# Altium project EMGfrontend.PrjPcb
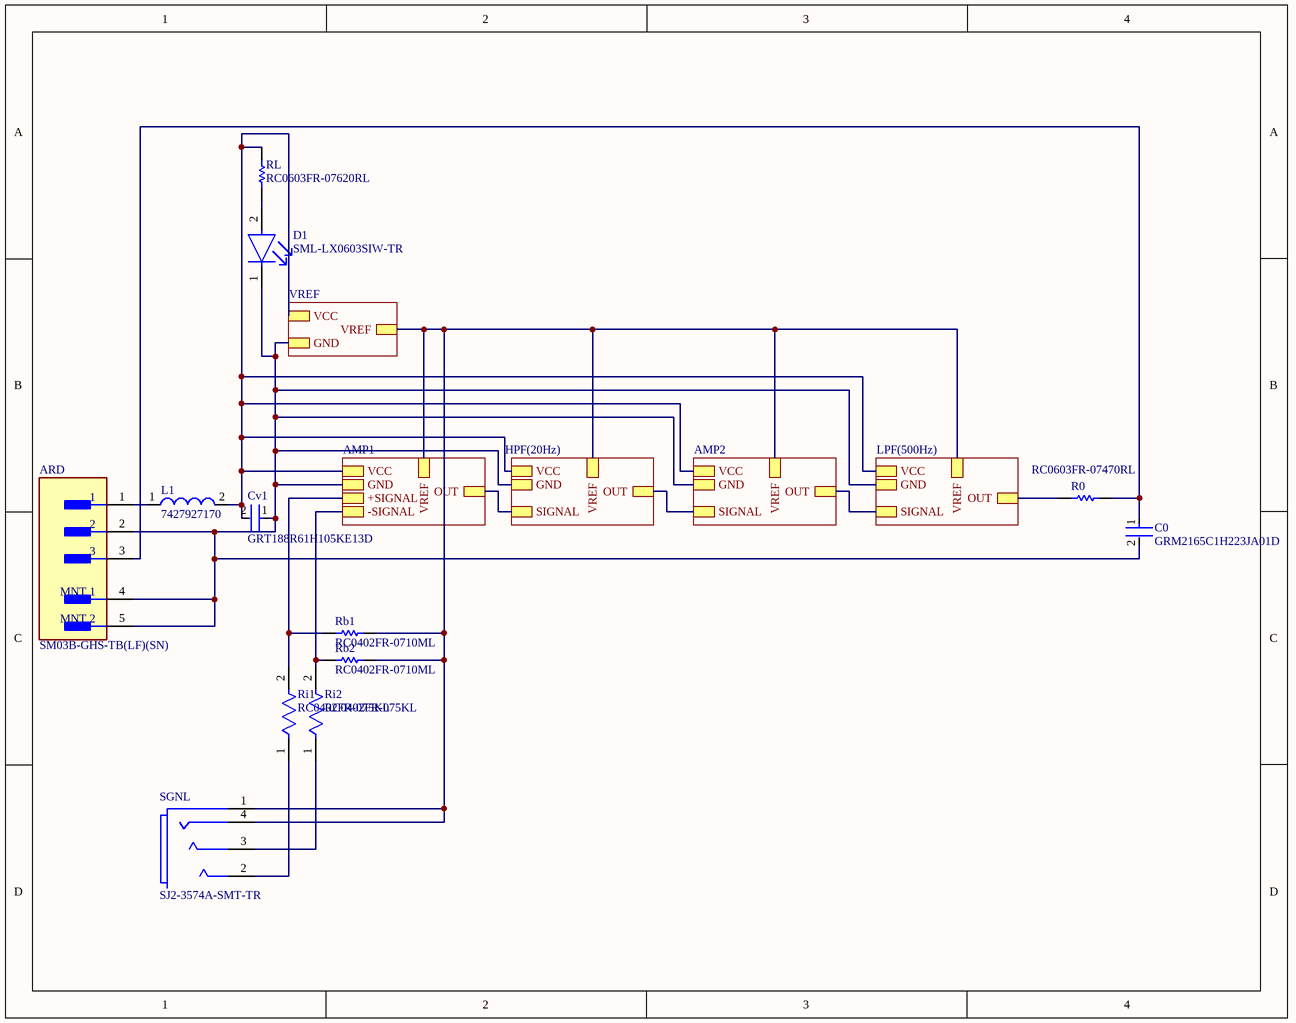
[diagram p0: EMGfrontend.SchDoc]
6 sheets, 35 parts. Net scope: hierarchical (ports join the sheet entries above them; power ports are global).
Board file: EMGfrontend.PcbDoc
Sheets:
  EMGfrontend.SchDoc
    VREF = VREF.SchDoc
    AMP2 = AMP2.SchDoc
    LPF(500Hz) = LPF(500Hz).SchDoc
    AMP1 = AMP1.SchDoc
    HPF(20Hz) = HPF(20Hz).SchDoc

## Sheet EMGfrontend.SchDoc
size A; SheetNumber: 1; SheetTotal: 6

### Parts
ARD  SM03B-GHS-TB(LF)(SN)  [FP-SM03B-GHS-TB_LF_SN-MFG]
C0  GRM2165C1H223JA01D  [FP-GRM216-0_1-0_05-D]
Cv1  GRT188R61H105KE13D  [FP-GRT188-0_1-e0_2_0_5-IPC_B]
D1  SML-LX0603SIW-TR  [FP-SML-LX0603SIW-TR-MFG]
L1  7427927170  [SMD-0402]
R0  RC0603FR-07470RL  [RESC1608X55X25LL10T15]
Rb1  RC0402FR-0710ML  [RESC1005X40X25MML05T10]
Rb2  RC0402FR-0710ML  [RESC1005X40X25MML05T10]
Ri1  RC0402FR-075KL  [FP-RC0402-MFG-TINY]
Ri2  RC0402FR-075KL  [FP-RC0402-MFG-TINY]
RL  RC0603FR-07620RL  [RESC1608X55X25ML10T15]
SGNL  SJ2-3574A-SMT-TR  [FP-SJ2-3574A-SMT-TR-MFG]

### Sub-sheets
AMP1 = AMP1.SchDoc: VREF, +SIGNAL, OUT, GND, VCC, -SIGNAL
AMP2 = AMP2.SchDoc: VREF, SIGNAL, VCC, GND, OUT
HPF(20Hz) = HPF(20Hz).SchDoc: SIGNAL, VREF, OUT, VCC, GND
LPF(500Hz) = LPF(500Hz).SchDoc: SIGNAL, VCC, GND, VREF, OUT
VREF = VREF.SchDoc: VREF, VCC, GND

### Nets
NetARD_1: ARD.1 L1.1
NetARD_2: ARD.2 ARD.4(MNT_1) ARD.5(MNT_2) C0.2 Cv1.1 D1.1(C) ; sheet VREF/GND, sheet AMP2/GND, sheet LPF(500Hz)/GND, sheet AMP1/GND, sheet HPF(20Hz)/GND
NetARD_3: ARD.3 C0.1 R0.2
NetC1_1: Rb1.2 Rb2.2 SGNL.1(sleeve) SGNL.4(ring_2) ; sheet VREF/VREF, sheet AMP2/VREF, sheet LPF(500Hz)/VREF, sheet AMP1/VREF, sheet HPF(20Hz)/VREF
NetC3_1: sheet AMP1/OUT, sheet HPF(20Hz)/SIGNAL
NetC4_2: R0.1 ; sheet LPF(500Hz)/OUT
NetCd1_1: Cv1.2 L1.2 RL.2 ; sheet VREF/VCC, sheet AMP2/VCC, sheet LPF(500Hz)/VCC, sheet AMP1/VCC, sheet HPF(20Hz)/VCC
NetD1_2: D1.2(A) RL.1
NetR5_2: sheet AMP2/SIGNAL, sheet HPF(20Hz)/OUT
NetR9_1: sheet AMP2/OUT, sheet LPF(500Hz)/SIGNAL
NetRb1_1: Rb1.1 Ri1.2 ; sheet AMP1/+SIGNAL
NetRb2_1: Rb2.1 Ri2.2 ; sheet AMP1/-SIGNAL
NetRi1_1: Ri1.1 SGNL.2(tip)
NetRi2_1: Ri2.1 SGNL.3(ring_1)

### Library data of the parts
ARD = CMP-17439-000068-1: CONN HEADER SMD R/A 3POS 1.25MM; Voltage Rating: 50V; Wire/Cable Gauge: 26AWG; Pitch: 0.049inch; Gender: Male; Number of Positions: 3; Current Rating: 1A; Orientation: Right Angle; REACH SVHC: No SVHC; Insulation Color: Natural; Housing Material: Nylon; Mount: Surface Mount; Flammability Rating: UL94 V-0; Color: Natural; Number of Rows: 1; Housing Color: Natural; Termination: Solder; Voltage Rating (AC): 50V; Max Operating Temperature: 85°C; Connector Type: Header; Series: GH; Packaging: Tape and Reel; Contact Finish - Mating: TIN; Lead Free: Lead Free; Fastening Type: Ramp; Contact Plating: Tin; Contact Material: Bronze; Insulation Material: Nylon; Contact Type: Outer Shroud Contact; Number of Contacts: 3; Min Operating Temperature: -25°C; Contact Shape: Rectangular
C0 = CMP-06035-050815-1: Chip Multilayer Ceramic Capacitors for General Purpose, 0805, 22000pF, C0G, 30ppm/°C, 5%, 50V
Cv1 = CMP-06035-031856-1: Multi-Layer Ceramic Capacitor 1uF 50V X5R ±10% 0603 Paper T/R; Voltage Rating (DC): 50V; Voltage Rating: 50V; Min Operating Temperature: -55°C; Case Code (Metric): 1608; Thickness: 0.035inch; Width: 0.031inch; Capacitance: 1uF; Tolerance: 10%; Max Operating Temperature: 85°C; Dielectric: X5R; Case Code (Imperial): 0603; Case/Package: 0603; Length: 0.063inch; Packaging: Tape and Reel; Mount: Surface Mount; Ratings: AEC-Q200
D1 = CMP-57192-000009-1: LED RED DIFFUSED SMD; Test Current: 20mA; Forward Voltage: 2V; Approvals: UL; Dominant Wavelength: 636nm; Viewing Angle: 140°; Lens Color: White; Luminous Intensity: 60mcd; Power Rating: 50mW; Number of LEDs: 1; Color: Red; Forward Current: 20mA; Moisture Sensitivity Level: 2; Case Code (Imperial): 0603; Lead Free: Lead Free; Lens Transparency: Diffused; Case Code (Metric): 1608; Height: 0.6mm; Max Operating Temperature: 85°C; Width: 0.8mm; Lens Style: Diffused; Illumination Color: Red; Wavelength: 636nm; REACH SVHC: No SVHC; Package Quantity: 1; RoHS Compliant: Yes; Case/Package: 0603; Number of Pins: 2; Packaging: Tape and Reel; Length: 1.6mm; Mount: Surface Mount; Min Operating Temperature: -25°C
L1 = CMP-0220-00142-1: SMD EMI Suppression Ferrite Bead WE-CBF, Z = 75 Ohm; Impedance: 75 Ohm; ComponentLink2Description: Datasheet; ComponentLink2URL: http://www.we-online.de/katalog/media/pdf/7427927170.pdf; ComponentLink1URL: http://www.we-online.com; PackageVersion: 2009; ComponentLink1Description: Manufacturer Link; PackageReference: SMD-0402; PackageDescription: Chip Inductor, 2-Leads, Body 1.0 x 0.5 mm; DatasheetVersion: ver 1, Jul-2009
R0 = CMP-1659-00035-2: General Purpose Chip Resistor, 470 Ohm, +/- 1%, -55 to 155 degC, 0603 (1608 Metric), RoHS, Tape and Reel; Resistance: 470 Ohm; ComponentLink1Description: Manufacturer URL; Contact Plating: Gold; Width: 3.1 mm; Radiation Hardening: No; DatasheetVersion: Rev. 4, 04/2009; Length: 3 mm; PackageDescription: 2-Pin Surface Mount Device, Body 1.6 x 0.8 mm; ComponentLink1URL: http://www.yageo.com/; Min Operating Temperature: -40 degC; Mount: Surface Mount; Package Quantity: 2500; ComponentLink2URL: https://datasheet.ciiva.com/11808/0900766b80f96399-11808177.pdf; RoHSCompliant: true; Fastening Type: Snap; PackageReference: 0603; Max Operating Temperature: 90 degC; Height: 1.25 mm; Packaging: Tape and Reel; ComponentLink2Description: Datasheet; Contact Material: Brass
Rb1 Rb2 = CMP-2002-07354-1: Manufacturer: Yageo / Phycomp; Part Number: RC0402FR-0710ML
Ri1 Ri2 = CMP-03412-013078-1: RES SMD 5K OHM 1% 1/16W 0402; Manufacturer: Yageo; Resistance: 5kΩ; Temperature Coefficient: 100ppm/°C; Power Rating: 0.0625W; Voltage Rating: 50V; Value: 5kΩ; Temperature Range Low: -55°C; Lead Free: Yes; RoHS: TRUE; Device Class L2: Resistors; Package: RC0402; Footprint Url: https://pccomponents.com/datasheets/YAGEO-20RESISTORS.PDF; Height: 0.4mm; ComponentLink2URL: http://www.yageo.com/documents/recent/PYu-RC_Group_51_RoHS_L_10.pdf; Temperature: -55°C to +155°C; Composition: Thick Film; Device Class L1: Passive Components; Series: RC_L; Ipc Land Pattern Name: RESC10050X35; Tolerance: 1%; Device Class L3: Chip SMD Resistors; Temperature Range High: +155°C; Category: Res; Automotive: No; Octopart: https://octopart.com/rc0402fr-075kl-yageo-25450038; Digikey Description: RES SMD 5K OHM 1% 1/16W 0402; ComponentLink2Description: Datasheet; Manufacturer Part Number: RC0402FR-075KL
RL = CMP-2000-04103-1: Manufacturer: Yageo; Part Number: RC0603FR-07620RL
SGNL = CMP-14818-000001-1: AUDIO JACK, 3.5 MM, RT, 4 CONDUC; Manufacturer: CUI; Conn Orientation: Horizontal; Current Rating: 1A; Number Of Contacts: 4; Voltage Rating: 12V; Package: SJ2-3574A-SMT-TR; Device Class L1: Connectors; Lead Free: Yes; Digikey Description: AUDIO JACK, 3.5 MM, RT, 4 CONDUC; Device Class L2: Audio / Video Connectors; ComponentLink2URL: https://www.cui.com/product/resource/sj2-357x-smt.pdf; Automotive: No; RoHS: TRUE; Height: 5.3mm; Temperature Range Low: -25°C; Category: Conn; Temperature: -25°C to +85°C; Octopart: https://octopart.com/sj2-3574a-smt-tr-cui-77838840; Device Class L3: unset; Contact Material: Silver; Manufacturer Part Number: SJ2-3574A-SMT-TR; Temperature Range High: +85°C; ComponentLink2Description: Datasheet

## Sheet VREF.SchDoc
size A; SheetNumber: 2; SheetTotal: 6
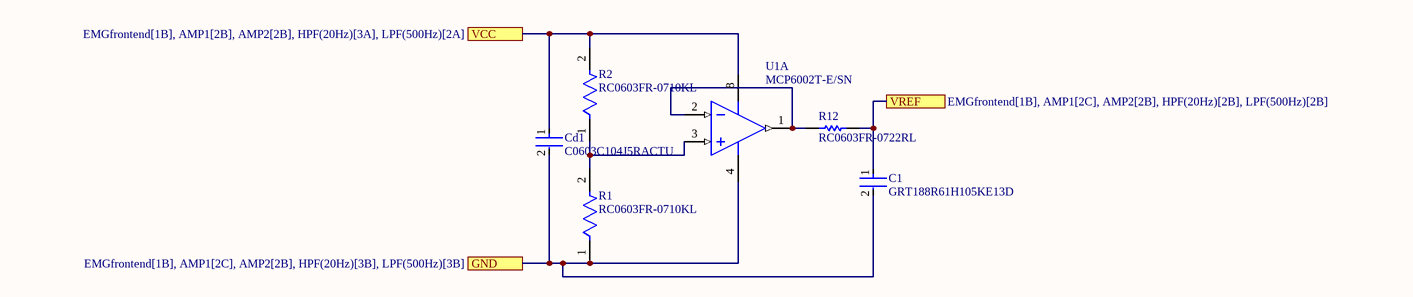
[diagram p1: VREF.SchDoc]

### Parts
C1  GRT188R61H105KE13D  [FP-GRT188-0_1-e0_2_0_5-IPC_B]
Cd1  C0603C104J5RACTU  [FP-C0603C-CF-MFG]
R1  RC0603FR-0710KL  [FP-RC0603-0_55-IPC_C]
R2  RC0603FR-0710KL  [FP-RC0603-0_55-IPC_C]
R12  RC0603FR-0722RL  [RESC1608X55X25NL10T15]
U1  MCP6002T-E/SN  [SOIC-SN8_N]  (part A of 2)

### Ports
GND (see EMGfrontend[1B], AMP1[2C], AMP2[2B], HPF(20Hz)[3B], LPF(500Hz)[3B]), VCC (see EMGfrontend[1B], AMP1[2B], AMP2[2B], HPF(20Hz)[3A], LPF(500Hz)[2A]), VREF (see EMGfrontend[1B], AMP1[2C], AMP2[2B], HPF(20Hz)[2B], LPF(500Hz)[2B])

### Nets
NetARD_2: C1.2 Cd1.2 R1.1 U1.4(VSS) ; port GND
NetC1_1: C1.1 R12.2 ; port VREF
NetCd1_1: Cd1.1 R2.2 U1.8(VDD) ; port VCC
NetR1_2: R1.2 R2.1 U1.3(VINA+)
NetR12_1: R12.1 U1.1(VOUTA) U1.2(VINA-)

### Notes on the sheet
- (in symbol CMP-06302-000184-2) +; -

### Library data of the parts
C1 = CMP-06035-031856-1: as Cv1 on sheet EMGfrontend; Voltage Rating (DC): 50V; Voltage Rating: 50V; Min Operating Temperature: -55°C; Case Code (Metric): 1608; Thickness: 0.035inch; Width: 0.031inch; Capacitance: 1uF; Tolerance: 10%; Max Operating Temperature: 85°C; Dielectric: X5R; Case Code (Imperial): 0603; Case/Package: 0603; Length: 0.063inch; Packaging: Tape and Reel; Mount: Surface Mount; Ratings: AEC-Q200
Cd1 = CMP-2006-03056-2: CAP CER 0.1UF 50V 5% X7R 0603; Manufacturer: KEMET; Automotive Grade: Grade 1; Tolerance: 0.05; Capacitance: 0.10 μF; Value: 0.10 μF; Temperature Coefficient: 30ppm/°C; ComponentLink2Description: Datasheet; Voltage Rating: 50 V; Digikey Description: CAP CER 0.1UF 50V 5% X7R 0603; Manufacturer Part Number: C0603C104J5RACTU; Temperature Range High: +125°C; Device Class L2: Capacitors; Octopart: https://octopart.com/c0603c104j5ractu-kemet-10440638; RoHS: TRUE; Mouser Description: Multilayer Ceramic Capacitors MLCC - SMD/SMT 50volts 0.1uF X7R 5%; Temperature Range Low: -55°C; Automotive: Yes; Lead Free: Yes; ComponentLink2URL: https://api.kemet.com/component-edge/download/datasheet/C0603C100J5GACAUTO.pdf; Material: Ceramic; Device Class L3: Ceramic Capacitors; Package: C0603C-CF; Category: Cap; Temperature: -55°C to +125°C; Height: 0.87mm; Temperature Characteristic: X7R; Device Class L1: Passive Components
R1 R2 = CMP-2100-03664-2: RES 10K OHM 1% 1/10W 0603; Voltage Rating: 75V; Voltage Rating (DC): 50V; Resistance: 10kR; Power Rating: 100mW; Temperature Coefficient: 100ppm/°C; Depth: 0.8mm; Termination: SMD/SMT; Resistor Type: Thick Film; Series: RC; Construction: Rectangular; Features: Moisture Resistant; Packaging: Tape and Reel; Min Operating Temperature: -55°C; Number of Terminations: 2; Lead Pitch: 0.3mm; RoHS Compliant: Yes; Case/Package: 0603; Resistance Tolerance: 1%; Military Standard: Not; Weight: 7.1E-05oz; Number of Pins: 2; Tolerance: 1%; Length: 1.6mm; Case Code (Imperial): 0603; Lead Free: Lead Free; Width: 0.8mm; Max Power Dissipation: 100mW; Height: 0.45mm; Max Operating Temperature: 155°C; Case Code (Metric): 1608; Size Code: 0603
R12 = CMP-1659-00033-1: Chip Resistor, 22 Ohm, +/- 1%, 0.1 W, -55 to 155 degC, 0603 (1608 Metric), RoHS, Tape and Reel; Max Ouput Current: 8 A; Case\Package: SIP; Max Input Voltage: 1.4 V; ComponentLink2URL: http://www.yageo.com/documents/recent/PYu-RC_Group_51_RoHS_L_04.pdf; RoHSCompliant: true; Max Operating Temperature: 100 degC; PackageDescription: 2-Pin Surface Mount Device, Body 1.6 x 0.8 mm; ComponentLink1Description: Manufacturer URL; ComponentLink1URL: http://www.yageo.com/; Length: 18.5 mm; REACH SVHC: Unknown; Pins: 4; DatasheetVersion: Rev. 4, 02/2016; PackageReference: 0603; Output Current: 8 A; Min Operating Temperature: -25 degC; Height: 19.6 mm; Mount: Through Hole; Radiation Hardening: No; ComponentLink2Description: Datasheet; Package Quantity: 200; Packaging: Rail/Tube
U1 = CMP-0187-00363-3: None; Nominal Supply Current: 100uA; Operating Supply Voltage: 5.5V; Input Bias Current: 1pA; Output Current per Channel: 23mA; Unity Gain Bandwidth Product: 1MHz; Number of Elements: 2; Power Supply Rejection Ratio (PSRR): 86dB; Slew Rate: 0.6V/µs; Min Supply Voltage: 1.8V; Voltage Gain: 112dB; Max Supply Voltage: 6V; Input Offset Voltage (Vos): 4.5mV; Common Mode Rejection Ratio: 60dB; Amplifier Type: GENERAL PURPOSE; Technology: CMOS; Output Current: 23mA; Number of Pins: 8; Lead Free: Lead Free; Number of Channels: 2; Package Quantity: 3300; Max Operating Temperature: 125°C; Number of Circuits: 2; Supply Current: 100uA; Gain Bandwidth Product: 1MHz; Min Operating Temperature: -40°C; Series: -; Mount: Surface Mount; Case/Package: SOIC; Radiation Hardening: No; Packaging: Tape and Reel; Operating Supply Current: 100uA; RoHS Compliant: Yes

## Sheet AMP2.SchDoc
size A; SheetNumber: 5; SheetTotal: 6
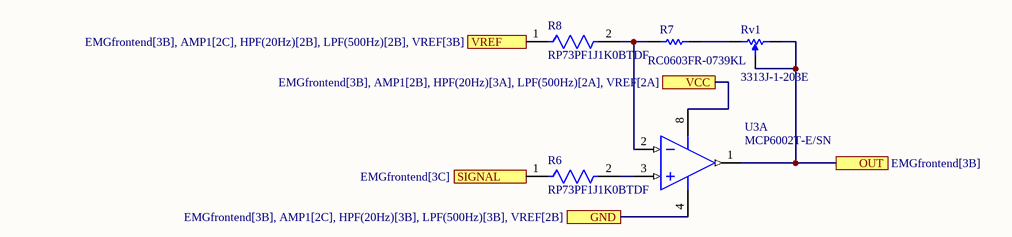
[diagram p2: AMP2.SchDoc]

### Parts
R6  RP73PF1J1K0BTDF  [FP-RP73P-1J-MFG]
R7  RC0603FR-0739KL  [RESC1608X55X25LL10T15]
R8  RP73PF1J1K0BTDF  [FP-RP73P-1J-MFG]
Rv1  3313J-1-203E  [BOUR-3313J-1_V]
U3  MCP6002T-E/SN  [SOIC-SN8_N]  (part A of 2)

### Ports
GND (see EMGfrontend[3B], AMP1[2C], HPF(20Hz)[3B], LPF(500Hz)[3B], VREF[2B]), OUT (see EMGfrontend[3B]), SIGNAL (see EMGfrontend[3C]), VCC (see EMGfrontend[3B], AMP1[2B], HPF(20Hz)[3A], LPF(500Hz)[2A], VREF[2A]), VREF (see EMGfrontend[3B], AMP1[2C], HPF(20Hz)[2B], LPF(500Hz)[2B], VREF[3B])

### Nets
NetARD_2: U3.4(VSS) ; port GND
NetC1_1: R8.1 ; port VREF
NetCd1_1: U3.8(VDD) ; port VCC
NetR5_2: R6.1 ; port SIGNAL
NetR6_2: R6.2 U3.3(VINA+)
NetR7_1: R7.1 R8.2 U3.2(VINA-)
NetR7_2: R7.2 Rv1.1
NetR9_1: Rv1.2 Rv1.3 U3.1(VOUTA) ; port OUT

### Library data of the parts
R6 R8 = CMP-03211-004517-1: RES SMD 1K OHM 0.1% 1/6W 0603; Manufacturer: TE Connectivity; Value: 1KΩ; Power Rating: 0.166W; Tolerance: 0.001; Temperature Coefficient: 25ppm/°C; Voltage Rating: 100V; Composition: Thin Film; Category: Res; Temperature Range High: +155°C; Device Class L1: Passive Components; Digikey Description: RES SMD 1K OHM 0.1% 1/6W 0603; Lead Free: Yes; RoHS: TRUE; Ipc Land Pattern Name: RESC15580X45; Automotive: No; Temperature: -55°C to +155°C; Height: 0.55mm; ComponentLink2URL: https://www.te.com/commerce/DocumentDelivery/DDEController?Action=srchrtrv&DocNm=1773272&DocType=DS&DocLang=English; Manufacturer Part Number: RP73PF1J1K0BTDF; Resistance: 1KΩ; ComponentLink2Description: Datasheet; Temperature Range Low: -55°C; Octopart: https://octopart.com/rp73pf1j1k0btdf-te+connectivity-45465729; Device Class L3: Chip SMD Resistors; Series: RP73P; Package: RP73P-1J; Device Class L2: Resistors
R7 = CMP-2000-06940-1: Chip Resistor, 39 KOhm, +/- 1%, 0.1 W, -55 to 155 degC, 0603 (1608 Metric), RoHS, Tape and Reel; Manufacturer: Yageo; Resistance: 39kOhms; Voltage Rating: 50V; Power Rating: 100mW; Temperature Coefficient: 100PPM/C; Product: ThickFilmResistorsGeneralPurpose; Case Code - in: 0603; Tolerance: 1%; Operating Temperature Range: -55Cto+155C; Series: RC; Package Description: 2-Pin Surface Mount Device, Body 1.6 x 0.8 mm; Datasheet URL: http://www.yageo.com/documents/recent/PYu-RC_Group_51_RoHS_L_7.pdf; Package Reference: 0603; Case Code - mm: 1608; Datasheet Version: Rev. 7, 05/2017; Mounting Technology: SurfaceMount; Packaging: Reel; Manufacturer URL: http://www.yageo.com/; Termination Style: SMD/SMT
Rv1 = CMP-2000-05586-1: 3 mm Trimpot(R) Trimming Potentiometer, 20 KOhm, +/- 20%, 0.125 W, -55 to 125 degC, 3-Pin SMD, RoHS, Tape and Reel; Manufacturer: Bourns; Insulation Resistance: 100Megohms(Min.)@500VDC; Rotational Life: 100Cycles; Resolution: Infinite; Brand/Series: Trimpot®3313-SealedSeries; Temperature, Operating, Maximum: +125°C; Resistance: 20Kilohms; Resistance, Insulation: 100Megohms; Material, Element: Cermet; Standards: RoHSCompliant; Dielectric Strength: 500VAC; Load Life: 1000hr@0.125W,70°C; Torque: 50g-cm; Temperature Coefficient: ±100ppm/°C; Number of Turns: 1; Power, Rating: 0.125W; Angle, Mechanical: 250°; Temperature, Operating, Minimum: -55°C; Package Reference: 3313J-1; Dimensions: 0.126"Lx0.138"Wx0.087"H; Tolerance: ±20%; Type: Trimmer; Package Description: 3-Pin Surface Mount Device, Body 3.5 x 3.2 mm, Pitch 1.15 mm; Mounting Technology: SurfaceMount; Datasheet URL: http://www.bourns.com/docs/Product-Datasheets/3313.pdf; Mounting Type: SurfaceMount; Manufacturer URL: http://www.bourns.com/; Datasheet Version: 05/2016; Termination: SMD
U3 = CMP-0187-00363-3: as U1 on sheet VREF; Technology: CMOS; Output Current: 23mA; Number of Pins: 8; Lead Free: Lead Free; Number of Channels: 2; Package Quantity: 3300; Max Operating Temperature: 125°C; Number of Circuits: 2; Supply Current: 100uA; Gain Bandwidth Product: 1MHz; Min Operating Temperature: -40°C; Series: -; Mount: Surface Mount; Case/Package: SOIC; Radiation Hardening: No; Packaging: Tape and Reel; Operating Supply Current: 100uA; RoHS Compliant: Yes

## Sheet LPF(500Hz).SchDoc
size A; SheetNumber: 6; SheetTotal: 6
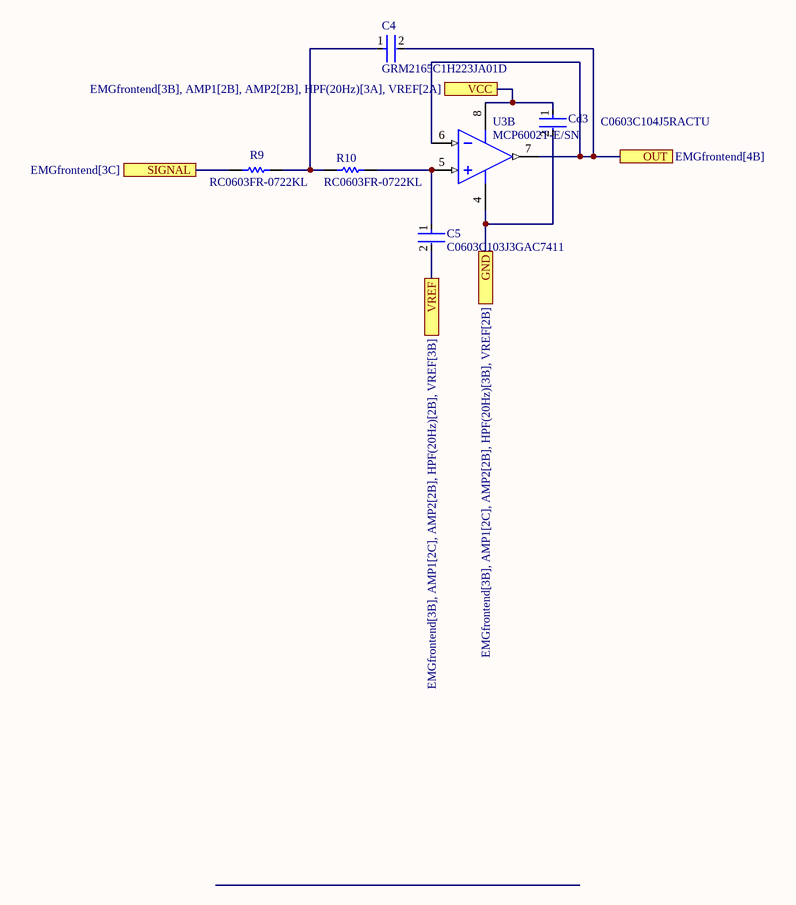
[diagram p3: LPF(500Hz).SchDoc]

### Parts
C4  GRM2165C1H223JA01D  [FP-GRM216-0_1-0_05-D]
C5  C0603C103J3GAC7411  [FP-C0603C-CF-MFG]
Cd3  C0603C104J5RACTU  [FP-C0603C-CF-MFG]
R9  RC0603FR-0722KL  [RESC1608X55X25ML10T15]
R10  RC0603FR-0722KL  [RESC1608X55X25ML10T15]
U3  MCP6002T-E/SN  [SOIC-SN8_N]  (part B of 2)

### Ports
GND (see EMGfrontend[3B], AMP1[2C], AMP2[2B], HPF(20Hz)[3B], VREF[2B]), OUT (see EMGfrontend[4B]), SIGNAL (see EMGfrontend[3C]), VCC (see EMGfrontend[3B], AMP1[2B], AMP2[2B], HPF(20Hz)[3A], VREF[2A]), VREF (see EMGfrontend[3B], AMP1[2C], AMP2[2B], HPF(20Hz)[2B], VREF[3B])

### Nets
NetARD_2: Cd3.2 U3.4(VSS) ; port GND
NetC1_1: C5.2 ; port VREF
NetC4_1: C4.1 R9.2 R10.1
NetC4_2: C4.2 U3.6(VINB-) U3.7(VOUTB) ; port OUT
NetC5_1: C5.1 R10.2 U3.5(VINB+)
NetCd1_1: Cd3.1 U3.8(VDD) ; port VCC
NetR9_1: R9.1 ; port SIGNAL

### Library data of the parts
C4 = CMP-06035-050815-1: as C0 on sheet EMGfrontend
C5 = CMP-03020-031050-2: C0603 10,000 pF C0G 30ppm/°C 5.00% 25 V; Manufacturer: KEMET; Tolerance: 0.05; Material: Ceramic; Automotive Grade: Grade 1; Voltage Rating: 25 V; Device Class L3: Ceramic Capacitors; ComponentLink2URL: https://api.kemet.com/component-edge/download/datasheet/C0603C100J5GACAUTO.pdf; Capacitance: 10,000 pF; RoHS: TRUE; Manufacturer Part Number: C0603C103J3GAC7411; Temperature Coefficient: 30ppm/°C; Lead Free: Yes; Height: 0.87mm; Temperature Range Low: -55°C; Value: 10,000 pF; Temperature Range High: +125°C; ComponentLink2Description: Datasheet; Package: C0603C-CF; Temperature Characteristic: C0G; Temperature: -55°C to +125°C; Category: Cap; Octopart: https://octopart.com/c0603c103j3gac7411-kemet-91893810; Device Class L2: Capacitors; Device Class L1: Passive Components; Automotive: Yes
Cd3 = CMP-2006-03056-2: as Cd1 on sheet VREF; ComponentLink2Description: Datasheet; Voltage Rating: 50 V; Digikey Description: CAP CER 0.1UF 50V 5% X7R 0603; Manufacturer Part Number: C0603C104J5RACTU; Temperature Range High: +125°C; Device Class L2: Capacitors; Octopart: https://octopart.com/c0603c104j5ractu-kemet-10440638; RoHS: TRUE; Mouser Description: Multilayer Ceramic Capacitors MLCC - SMD/SMT 50volts 0.1uF X7R 5%; Temperature Range Low: -55°C; Automotive: Yes; Lead Free: Yes; ComponentLink2URL: https://api.kemet.com/component-edge/download/datasheet/C0603C100J5GACAUTO.pdf; Material: Ceramic; Device Class L3: Ceramic Capacitors; Package: C0603C-CF; Category: Cap; Temperature: -55°C to +125°C; Height: 0.87mm; Temperature Characteristic: X7R; Device Class L1: Passive Components
R9 R10 = CMP-1012-00659-3: Chip Resistor, 22 KOhm, +/- 1%, 0.1 W, -55 to 155 degC, 0603 (1608 Metric), RoHS, Tape and Reel; Tolerance: 10%; Current Rating: 290 mA; Shielding: Unshielded; Resistance: 2.9 Ohm; PackageReference: 0603; PackageDescription: 2-Pin Surface Mount Device, Body 1.6 x 0.8 mm; ComponentLink2URL: http://www.yageo.com/documents/recent/PYu-RC_Group_51_RoHS_L_04.pdf; RoHSCompliant: True; REACH SVHC: No SVHC; ComponentLink1Description: Manufacturer URL; ComponentLink2Description: Datasheet; DatasheetVersion: Rev. 4, 02/2016; Min Operating Temperature: -55degC; Pins: 2; Mount: Through Hole; Height: 11 mm; Packaging: Bulk; Radiation Hardening: No; Package Quantity: 100; Diameter: 8.5 mm; Lead Pitch: 5 mm; Case/Package: Radial; Max Operating Temperature: 105degC; ComponentLink1URL: http://www.yageo.com/
U3 = CMP-0187-00363-3: as U1 on sheet VREF; Technology: CMOS; Output Current: 23mA; Number of Pins: 8; Lead Free: Lead Free; Number of Channels: 2; Package Quantity: 3300; Max Operating Temperature: 125°C; Number of Circuits: 2; Supply Current: 100uA; Gain Bandwidth Product: 1MHz; Min Operating Temperature: -40°C; Series: -; Mount: Surface Mount; Case/Package: SOIC; Radiation Hardening: No; Packaging: Tape and Reel; Operating Supply Current: 100uA; RoHS Compliant: Yes

## Sheet AMP1.SchDoc
size A; SheetNumber: 3; SheetTotal: 6
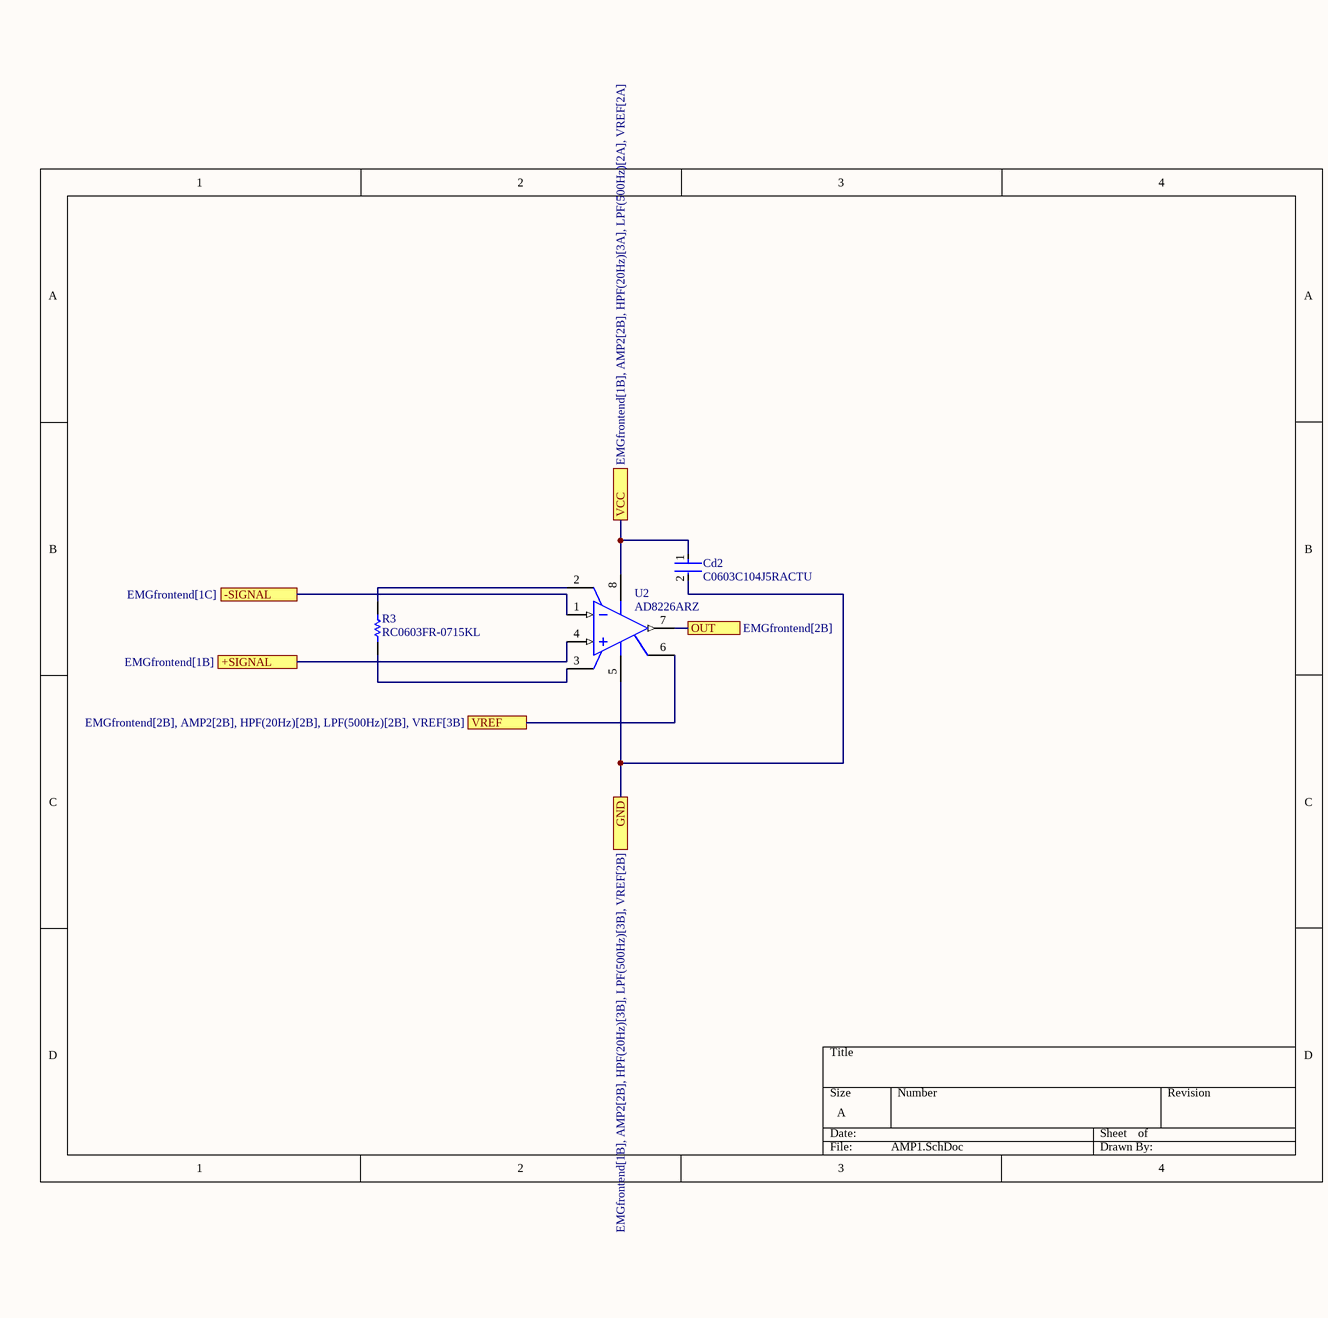
[diagram p4: AMP1.SchDoc]

### Parts
Cd2  C0603C104J5RACTU  [FP-C0603C-CF-MFG]
R3  RC0603FR-0715KL  [RESC1608X55X25LL10T15]
U2  AD8226ARZ  [ADI-R-8_L]

### Ports
+SIGNAL (see EMGfrontend[1B]), -SIGNAL (see EMGfrontend[1C]), GND (see EMGfrontend[1B], AMP2[2B], HPF(20Hz)[3B], LPF(500Hz)[3B], VREF[2B]), OUT (see EMGfrontend[2B]), VCC (see EMGfrontend[1B], AMP2[2B], HPF(20Hz)[3A], LPF(500Hz)[2A], VREF[2A]), VREF (see EMGfrontend[2B], AMP2[2B], HPF(20Hz)[2B], LPF(500Hz)[2B], VREF[3B])

### Nets
NetARD_2: Cd2.2 U2.5(-VS) ; port GND
NetC1_1: U2.6(REF) ; port VREF
NetC3_1: U2.7(VOUT) ; port OUT
NetCd1_1: Cd2.1 U2.8(+VS) ; port VCC
NetR3_1: R3.1 U2.3(RG)
NetR3_2: R3.2 U2.2(RG)
NetRb1_1: U2.4(+IN) ; port +SIGNAL
NetRb2_1: U2.1(-IN) ; port -SIGNAL

### Library data of the parts
Cd2 = CMP-2006-03056-2: as Cd1 on sheet VREF; ComponentLink2Description: Datasheet; Voltage Rating: 50 V; Digikey Description: CAP CER 0.1UF 50V 5% X7R 0603; Manufacturer Part Number: C0603C104J5RACTU; Temperature Range High: +125°C; Device Class L2: Capacitors; Octopart: https://octopart.com/c0603c104j5ractu-kemet-10440638; RoHS: TRUE; Mouser Description: Multilayer Ceramic Capacitors MLCC - SMD/SMT 50volts 0.1uF X7R 5%; Temperature Range Low: -55°C; Automotive: Yes; Lead Free: Yes; ComponentLink2URL: https://api.kemet.com/component-edge/download/datasheet/C0603C100J5GACAUTO.pdf; Material: Ceramic; Device Class L3: Ceramic Capacitors; Package: C0603C-CF; Category: Cap; Temperature: -55°C to +125°C; Height: 0.87mm; Temperature Characteristic: X7R; Device Class L1: Passive Components
R3 = CMP-1659-00032-1: Chip Resistor, 15 KOhm, +/- 1%, 0.1 W, -55 to 155 degC, 0603 (1608 Metric), RoHS, Tape and Reel; PackageDescription: 2-Pin Surface Mount Device, Body 1.6 x 0.8 mm; RoHSCompliant: true; ComponentLink2Description: Datasheet; DatasheetVersion: Rev. 4, 02/2016; ComponentLink1Description: Manufacturer URL; ComponentLink1URL: http://www.yageo.com/; PackageReference: 0603; ComponentLink2URL: http://www.yageo.com/documents/recent/PYu-RC_Group_51_RoHS_L_04.pdf
U2 = CMP-2000-05749-1: Wide Supply Range, Rail-to-Rail Output Instrumentation Amplifier, 2.2 to 36 V, -40 to 125 degC, 8-Pin SOIC (R-8), RoHS, Tube; Manufacturer: Analog Devices; PCN Design/Specification: PolyimideAlignmentTarget11/Aug/2015; Mfg Application Notes: AutomaticExternalDefibrillator(AED)SolutionsElectromagneticFlowMeterSolutionsMotorControlSolution—ServoControlProgrammableLogicControllers(PLCs)SolutionsElectrocardiogram(ECG)Solutions; EDA / CAD Models: DownloadfromAcceleratedDesigns; Design Resources: PLCandDCSUniversalAnalogInputUsingEither4or6-PinTerminalBlock; Current - Input Bias: 20nA; Product Training Modules: CommonPhotodiodeOp-AmpCircuitProblemsandSolutionsIndirectCurrentFeedbackInstrumentationAmplifierApplicationsGuide; -3db Bandwidth: 1.5MHz; Number of Circuits: 1; Current - Supply: 350µA; Current - Output / Channel: 13mA; Voltage - Input Offset: 100µV; Slew Rate: 0.6V/µs; Voltage - Supply, Single/Dual (±): 2.2V~36V,±1.35V~18V; Online Catalog: Instrumentation; Output Type: Rail-to-Rail; Mounting Type: SurfaceMount; Datasheet Version: Rev. C, 09/2012; Series: -; Category: IntegratedCircuits(ICs); Datasheet URL: http://www.analog.com/media/en/technical-documentation/data-sheets/AD8226.pdf; Mounting Technology: SurfaceMount; Standard Package: 98; Package / Case: 8-SOIC(0.154",3.90mmWidth); Package Description: 8-Pin Small Outline Package, Body 4.9 x 3.9 mm, Pitch 1.27 mm; Operating Temperature: -40°C~125°C; Gain Bandwidth Product: -; Manufacturer URL: http://www.analog.com/; Family: Linear-Amplifiers-Instrumentation,OPAmps,BufferAmps; Supplier Device Package: 8-SOIC; Package Reference: R-8; Amplifier Type: Instrumentation; Packaging: Tube

## Sheet HPF(20Hz).SchDoc
size A; SheetNumber: 4; SheetTotal: 6
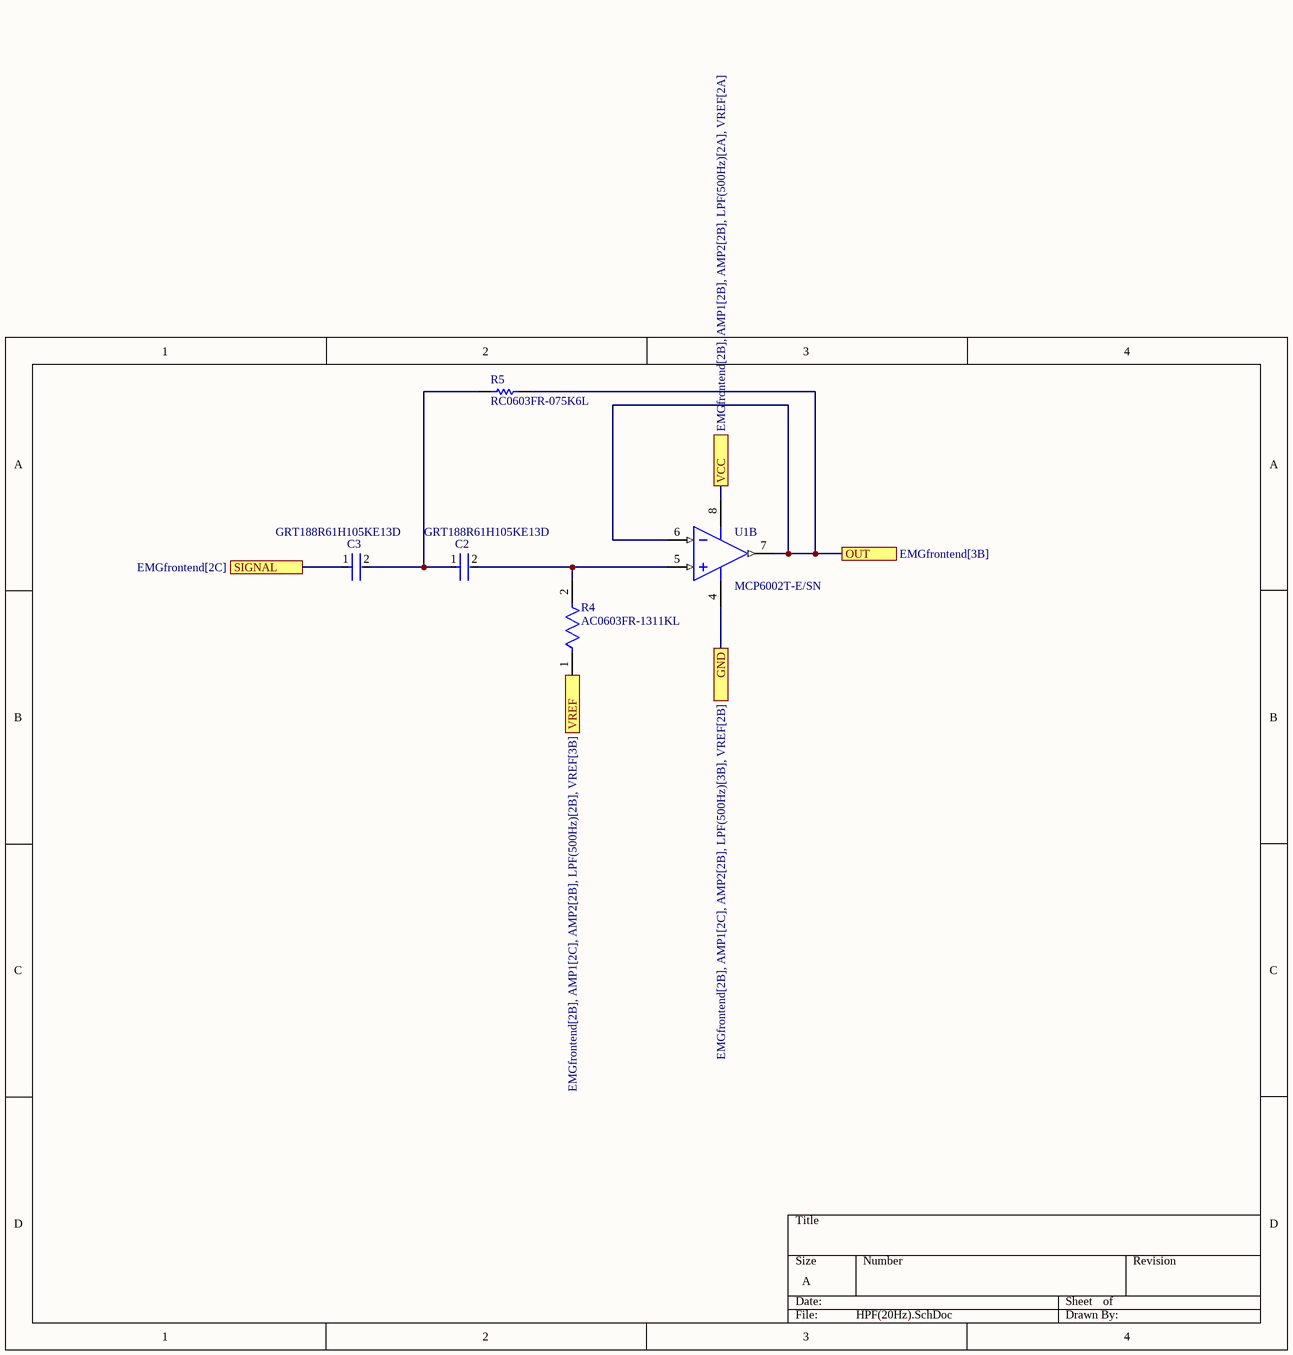
[diagram p5: HPF(20Hz).SchDoc]

### Parts
C2  GRT188R61H105KE13D  [FP-GRT188-0_1-e0_2_0_5-IPC_B]
C3  GRT188R61H105KE13D  [FP-GRT188-0_1-e0_2_0_5-IPC_B]
R4  AC0603FR-1311KL  [FP-AC0603-IPC_B]
R5  RC0603FR-075K6L  [RESC1608X55X25ML10T15]
U1  MCP6002T-E/SN  [SOIC-SN8_N]  (part B of 2)

### Ports
GND (see EMGfrontend[2B], AMP1[2C], AMP2[2B], LPF(500Hz)[3B], VREF[2B]), OUT (see EMGfrontend[3B]), SIGNAL (see EMGfrontend[2C]), VCC (see EMGfrontend[2B], AMP1[2B], AMP2[2B], LPF(500Hz)[2A], VREF[2A]), VREF (see EMGfrontend[2B], AMP1[2C], AMP2[2B], LPF(500Hz)[2B], VREF[3B])

### Nets
NetARD_2: U1.4(VSS) ; port GND
NetC1_1: R4.1 ; port VREF
NetC2_1: C2.1 C3.2 R5.1
NetC2_2: C2.2 R4.2 U1.5(VINB+)
NetC3_1: C3.1 ; port SIGNAL
NetCd1_1: U1.8(VDD) ; port VCC
NetR5_2: R5.2 U1.6(VINB-) U1.7(VOUTB) ; port OUT

### Notes on the sheet
- (in symbol CMP-06302-000184-2) +; -

### Library data of the parts
C2 C3 = CMP-06035-031856-1: as Cv1 on sheet EMGfrontend; Voltage Rating (DC): 50V; Voltage Rating: 50V; Min Operating Temperature: -55°C; Case Code (Metric): 1608; Thickness: 0.035inch; Width: 0.031inch; Capacitance: 1uF; Tolerance: 10%; Max Operating Temperature: 85°C; Dielectric: X5R; Case Code (Imperial): 0603; Case/Package: 0603; Length: 0.063inch; Packaging: Tape and Reel; Mount: Surface Mount; Ratings: AEC-Q200
R4 = CMP-03412-047641-1: RES 11KΩ 1.00% 0.1W 0603; RoHS Compliant: Yes
R5 = CMP-1012-00595-2: Chip Resistor, 5.6 KOhm, +/- 1%, 0.1 W, -55 to 155 degC, 0603 (1608 Metric), RoHS, Tape and Reel; Voltage Rating: 50 V; Case\Package: 0603; Power Rating: 100 mW; Type (Resistor): Thick Film; Resistance: 332 kohm; ComponentLink1Description: Manufacturer URL; Case Code (Metric): 1608; Height: 0.45 mm; Min Operating Temperature: -55 degC; RoHSCompliant: true; ComponentLink2URL: http://www.yageo.com/documents/recent/PYu-RC_Group_51_RoHS_L_04.pdf; Length: 1.6 mm; ComponentLink2Description: Datasheet; Width: 0.8 mm; PackageReference: 0603; DatasheetVersion: Rev. 4, 02/2016; Package Quantity: 5000; Tolerance: 1%; Case Code (Imperial): 0603; PackageDescription: 2-Pin Surface Mount Device, Body 1.6 x 0.8 mm; ComponentLink1URL: http://www.yageo.com/; Max Operating Temperature: 155 degC; Packaging: Tape and Reel
U1 = CMP-0187-00363-3: as U1 on sheet VREF; Technology: CMOS; Output Current: 23mA; Number of Pins: 8; Lead Free: Lead Free; Number of Channels: 2; Package Quantity: 3300; Max Operating Temperature: 125°C; Number of Circuits: 2; Supply Current: 100uA; Gain Bandwidth Product: 1MHz; Min Operating Temperature: -40°C; Series: -; Mount: Surface Mount; Case/Package: SOIC; Radiation Hardening: No; Packaging: Tape and Reel; Operating Supply Current: 100uA; RoHS Compliant: Yes

## Nets that join several sheets
NetARD_2: EMGfrontend (6 pins), VREF (C1.2 Cd1.2 R1.1 U1.4), AMP2 (U3.4), LPF(500Hz) (Cd3.2 U3.4), AMP1 (Cd2.2 U2.5), HPF(20Hz) (U1.4)
NetC1_1: EMGfrontend (Rb1.2 Rb2.2 SGNL.1 SGNL.4), VREF (C1.1 R12.2), AMP2 (R8.1), LPF(500Hz) (C5.2), AMP1 (U2.6), HPF(20Hz) (R4.1)
NetC3_1: AMP1 (U2.7), HPF(20Hz) (C3.1)
NetC4_2: EMGfrontend (R0.1), LPF(500Hz) (C4.2 U3.6 U3.7)
NetCd1_1: EMGfrontend (Cv1.2 L1.2 RL.2), VREF (Cd1.1 R2.2 U1.8), AMP2 (U3.8), LPF(500Hz) (Cd3.1 U3.8), AMP1 (Cd2.1 U2.8), HPF(20Hz) (U1.8)
NetR5_2: AMP2 (R6.1), HPF(20Hz) (R5.2 U1.6 U1.7)
NetR9_1: AMP2 (Rv1.2 Rv1.3 U3.1), LPF(500Hz) (R9.1)
NetRb1_1: EMGfrontend (Rb1.1 Ri1.2), AMP1 (U2.4)
NetRb2_1: EMGfrontend (Rb2.1 Ri2.2), AMP1 (U2.1)